# Altium schematic sheet rev-b1_case_charger.SchDoc
size 297 x 209 mm; Symbol: Drawing-Symbol_A4; @Project Name: Atrium_RevB1; @Page Count: 1; @Update Date: 2026-11-05; @Create Date: 2026-11-05; @Schematic Name: Schematic1; @Page No: 1; @Page Name: P1; Company: Local Forge; Version: V1.0; Page Size: A4; Drawn: Het Bhavsar; Device: Drawing-Symbol_A4; @Create Time: 20:16:12; @Update Time: 20:16:12; Border: 1; Width: 1170; Height: 825; Region Start: 1; X Region Count: 6; Y Region Count: 4; Blade Width: 10; Title Block Position: 3; @Board Name: zArchive_Case_old_rev
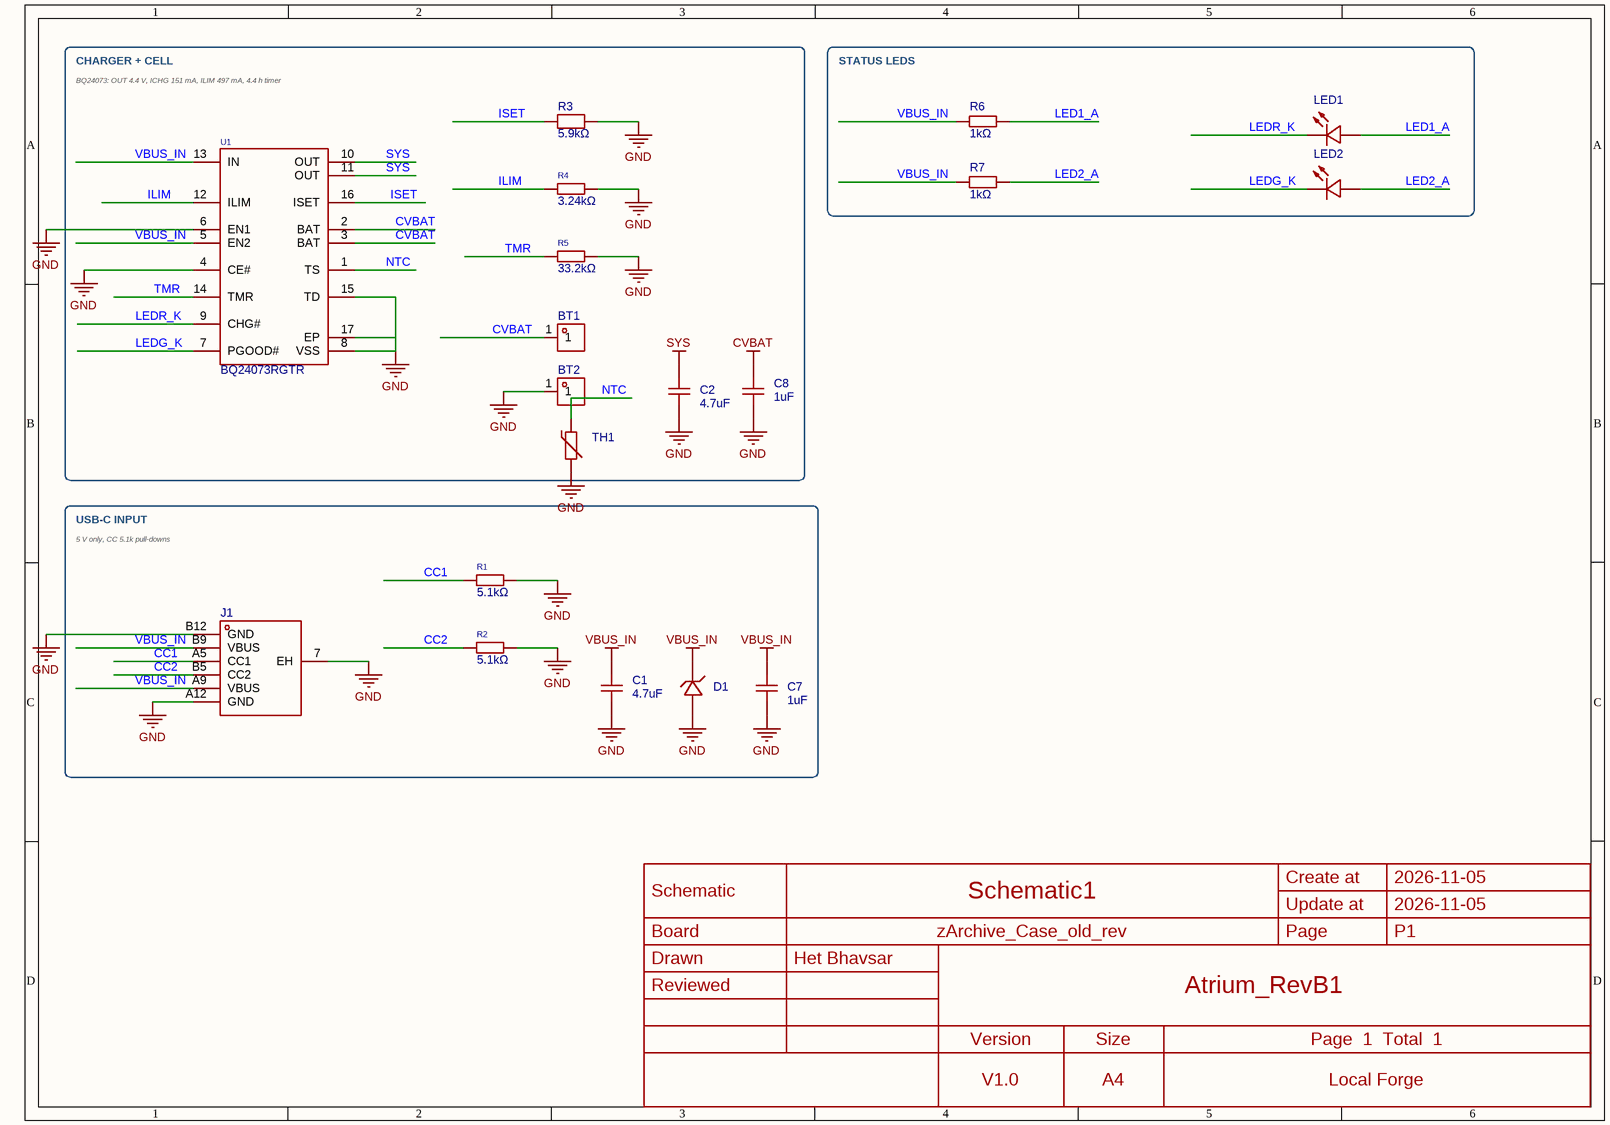
[diagram p0: rev-b1_case_charger.SchDoc]

## Parts
BT1  YZR0154-15039-02  [TESTPOINT-SMD_BD1.5-H3.9]  (value not drawn)
BT2  YZR0154-15039-02  [TESTPOINT-SMD_BD1.5-H3.9]  (value not drawn)
C1  4.7uF  [C0603]
C2  4.7uF  [C0603]
C7  1uF  [C0402]
C8  1uF  [C0402]
D1  SMF6.0A  [SOD-123FL_L2.8-W1.9-LS3.7-RD]  (value not drawn)
J1  TYPE-C 6P(073)  [TYPE-C-SMD_TYPE-C-6P-073]  (value not drawn)
LED1  KT-0603R  [LED-SMD_L1.6-W0.8-R-RD]  (value not drawn)
LED2  KT-0603G  [LED0603-RD]  (value not drawn)
R1  5.1kΩ  [R0402]
R2  5.1kΩ  [R0402]
R3  5.9kΩ  [R0402]
R4  3.24kΩ  [R0402]
R5  33.2kΩ  [R0402]
R6  1kΩ  [R0402]
R7  1kΩ  [R0402]
TH1  NCU15XH103F60RC  [R0402]  (value not drawn)
U1  BQ24073RGTR  [QFN-16_L3.0-W3.0-P0.50-TL-EP1.7]

## Blocks framed on the sheet
CHARGER + CELL: BT1 BT2 C2 C8 R3-R5 TH1 U1
STATUS LEDS: LED1 LED2 R6 R7
USB-C INPUT: C1 C7 D1 J1 R1 R2

## Nets
CVBAT: BT1.1 C8.1 U1.2(BAT) U1.3(BAT)
GND: BT2.1 C1.2 C2.2 C7.2 C8.2 D1.2(A) J1.7(EH) J1.A12(GND) J1.B12(GND) R1.2 R2.2 R3.2 R4.2 R5.2 TH1.2 U1.4(CE#) U1.6(EN1) U1.8(VSS) U1.15(TD) U1.17(EP)
SYS: C2.1 U1.10(OUT) U1.11(OUT)
VBUS_IN: C1.1 C7.1 D1.1(C) J1.A9(VBUS) J1.B9(VBUS) R6.1 R7.1 U1.5(EN2) U1.13(IN)
CC1: J1.A5(CC1) R1.1
CC2: J1.B5(CC2) R2.1
ILIM: R4.1 U1.12(ILIM)
ISET: R3.1 U1.16(ISET)
LED1_A: LED1.1(A) R6.2
LED2_A: LED2.2(A) R7.2
LEDG_K: LED2.1(K) U1.7(PGOOD#)
LEDR_K: LED1.2(K) U1.9(CHG#)
NTC: TH1.1 U1.1(TS)
TMR: R5.1 U1.14(TMR)

## Notes on the sheet
- BQ24073: OUT 4.4 V, ICHG 151 mA, ILIM 497 mA, 4.4 h timer
- 5 V only, CC 5.1k pull-downs
- Create at
- 2026-11-05
- Schematic
- Board
- Schematic1
- zArchive_Case_old_rev
- Update at
- Page
- P1
- Drawn
- Reviewed
- Het Bhavsar
- Atrium_RevB1
- Version
- V1.0
- Size
- A4
- Page  1  Total  1
- Local Forge

## Library data of the parts
BT1 BT2 = YZR0154-15039-02: Type:Pogo Pin Number of Pins:1P Overall Length/Height:3.9mm Operational Height:3.1mm Contact Resistance:50mΩ Elastic Life:10000 times Current Rating:1A Voltage Rating:12V Contact Material:Lead-Free Copper Contact Plating:Gold Operating Temperature:-20℃~+7; Manufacturer: Xinyangze(鑫扬泽); Add into BOM: no; Convert to PCB: yes; Overall Length/Height: 3.9mm; Operational Height: 3.1mm; Contact Resistance: 50mΩ; Current Rating: 1A; Voltage Rating: 12V; Symbol: YZR0154-15039-02; Device: YZR0154-15039-02; Manufacturer Part: YZR0154-15039-02; Supplier: LCSC; Supplier Part: C5157388; LCSC Part Name: POGO PIN贴片型弹簧顶针; Supplier Footprint: -; JLCPCB Part Class: Extended Part; Datasheet: https://item.szlcsc.com/datasheet/YZR0154-15039-02/5795506.html; Type: Pogo Pin; Number of Pins: 1P; Elastic Life: 10000 times; Contact Material: Lead-Free Copper; Contact Plating: Gold; Operating Temperature: -20℃~+70℃; FootprintName: TESTPOINT-SMD_BD1.5-H3.9
C1 C2 = CL10A475KO8NNNC: Capacitance:4.7uF Tolerance:±10% Tolerance:±10% Voltage Rating:16V Temperature Coefficient:X5R; Manufacturer: SAMSUNG(三星); Add into BOM: yes; Tolerance: ±10%; Voltage Rating: 16V; Temperature Coefficient: X5R; ModelId: 624118aa3cc7497086c383c2d72e08520819f05c4eef4c71ace90d822a990e87; ModelName: C0603_L1.6-W0.8-H0.8; ModelTransform: 62.992,31.496,0,0,0,0,0,0,0; Symbol: CL10A475KO8NNNC; Device: CL10A475KO8NNNC; Convert to PCB: yes; Manufacturer Part: CL10A475KO8NNNC; Supplier: LCSC; Supplier Part: C19666; LCSC Part Name: 4.7uF ±10% 16V; Supplier Footprint: 0603; JLCPCB Part Class: Basic Part; Datasheet: https://item.szlcsc.com/datasheet/CL10A475KO8NNNC/20375.html; Value: 4.7uF; FootprintName: C0603
C7 C8 = CL05A105KA5NQNC: Capacitance:1uF Tolerance:±10% Tolerance:±10% Voltage Rating:25V Temperature Coefficient:X5R; Manufacturer: SAMSUNG(三星); Add into BOM: yes; Tolerance: ±10%; Voltage Rating: 25V; Temperature Coefficient: X5R; ModelId: b7d13df3e9464d7a99d0651d1a5b4d570819f05c4eef4c71ace90d822a990e87; ModelName: C0402_L1.0-W0.5-H0.5; ModelTransform: 39.37,19.685,0,0,0,0,0,0,0; Symbol: CL05A105KA5NQNC; Device: CL05A105KA5NQNC; Convert to PCB: yes; Manufacturer Part: CL05A105KA5NQNC; Supplier: LCSC; Supplier Part: C52923; LCSC Part Name: 1uF ±10% 25V; Supplier Footprint: 0402; JLCPCB Part Class: Basic Part; Datasheet: https://item.szlcsc.com/datasheet/CL05A105KA5NQNC/53938.html; Value: 1uF; FootprintName: C0402
D1 = SMF6.0A_C2857264: Polarity:Unidirectional Reverse Stand-Off Voltage (Vrwm):6V Clamping Voltage:10.3V Peak Pulse Current (Ipp):19.4A Peak Pulse Power Dissipation (Ppp):200W Voltage - Breakdown:6.7V Reverse Leakage Current (Ir):100uA Number of Channels:1 Operating Temperatur; Manufacturer: JSMSEMI(杰盛微); Add into BOM: yes; Reverse Stand-Off Voltage (Vrwm): 6V; Clamping Voltage: 10.3V; Peak Pulse Current (Ipp): 19.4A; Peak Pulse Power Dissipation (Ppp): 200W; Voltage - Breakdown: 6.7V; Reverse Leakage Current (Ir): 100uA; Number of Channels: 1; Type: TVS; ModelId: 651a00fc4da743e19c1dbf8711bab2380819f05c4eef4c71ace90d822a990e87; ModelTransform: 141.732,74.803,0,0,0,0,0,0,0; Symbol: SMF6.0A_C2857264; Device: SMF6.0A_C2857264; Convert to PCB: yes; Manufacturer Part: SMF6.0A; Supplier: LCSC; Supplier Part: C2857264; LCSC Part Name: TVS 6V截止 峰值浪涌电流：19.4A; Supplier Footprint: SOD-123FL; JLCPCB Part Class: Extended Part; Datasheet: https://item.szlcsc.com/datasheet/SMF6.0A/3057376.html; Polarity: Unidirectional; Operating Temperature: -55℃~+150℃; level of protection: -; Junction Capacitance: -; FootprintName: SOD-123FL_L2.8-W1.9-LS3.7-RD; ModelName: SOD-123FL_L2.8-W1.9-LS3.7-RD
J1 = TYPE-C 6P(073): Connector Type:Type-C Protocol Standard:- Gender:Female Mounting Type:Surface Mount, Right Angle Number of Contacts:6P Number of Ports:1 Current Rating-Power:3A Voltage Rating:5V Connect-Disconnect Life:10,000 cycles Supplementary Features:- Center Height; Manufacturer: SHOU HAN(首韩); Add into BOM: yes; Gender: Female; Number of Ports: 1; Current Rating-Power: 3A; Voltage Rating: 5V; Detection color: Black; ModelId: 5572357f2a5242b0b12e4512f7b213ab0819f05c4eef4c71ace90d822a990e87; ModelTransform: 351.968,281.49546,0,0,0,0,0.002,-46.967,-39.37; Symbol: TYPE-C 6P(073); Device: TYPE-C 6P(073); Convert to PCB: yes; Manufacturer Part: TYPE-C 6P(073); Supplier: LCSC; Supplier Part: C668623; LCSC Part Name: Type-C 母 卧贴; Supplier Footprint: SMD; JLCPCB Part Class: Extended Part; Datasheet: https://item.szlcsc.com/datasheet/TYPE-C%25206P(073)/698566.html; Connector Type: Type-C; Protocol Standard: -; Mounting Type: Surface Mount, Right Angle; Number of Contacts: 6P; Connect-Disconnect Life: 10,000 cycles; Supplementary Features: -; Center Height: -; Length: 6.8mm; Operating Temperature: -30℃~+80℃; FootprintName: TYPE-C-SMD_TYPE-C-6P-073; ModelName: TYPE-C-SMD_TYPE-C-6P-073
LED1 = KT-0603R: Lamp Holder Type:1.6mm x 0.8mm square LED Illumination Color:Red Voltage - Forward(Vf):1.8V~2.4V Voltage - Forward(Vf):1.8V~2.4V Power(Watts):40mW Forward Current:20mA Wavelength - Dominant:615nm~630nm Wavelength - Dominant:615nm~630nm Peak Wavelength:645; Manufacturer: KENTO; Add into BOM: yes; Illumination Color: Red; Power(Watts): 40mW; Forward Current: 20mA; Peak Wavelength: 645nm; Diode Configuration: Discrete Diode; Lens Color: Water Clear; Luminous Intensity: 300mcd; Viewing Angle: 120°; ModelId: 19cc79473bbc420a8203ad67d1a57d420819f05c4eef4c71ace90d822a990e87; ModelName: LED0603_L1.6-W0.8-H0.6; ModelTransform: 63.7794,31.496,0,0,0,0,0,0,0; Symbol: KT-0603R; Device: KT-0603R; Convert to PCB: yes; Manufacturer Part: KT-0603R; Supplier: LCSC; Supplier Part: C2286; LCSC Part Name: 0603 红灯 高亮; Supplier Footprint: 0603; JLCPCB Part Class: Basic Part; Datasheet: https://item.szlcsc.com/datasheet/KT-0603R/2659.html; Lamp Holder Type: 1.6mm x 0.8mm square LED; Voltage - Forward(Vf): 1.8V~2.4V; Wavelength - Dominant: 615nm~630nm; Color Temperature: -; Mounting Style: -; Operating Temperature: -40℃~+85℃; FootprintName: LED-SMD_L1.6-W0.8-R-RD
LED2 = KT-0603G: Lamp Holder Type:1.6mm x 0.8mm square LED Illumination Color:Emerald Green Voltage - Forward(Vf):3.1V Voltage - Forward(Vf):3.1V Power(Watts):100mW Forward Current:5mA Wavelength - Dominant:513nm~528nm Wavelength - Dominant:513nm~528nm Peak Wavelength:525; Manufacturer: KENTO; Symbol: 0603 Green 509-620mcd; Add into BOM: yes; Voltage - Forward(Vf): 3.1V; Power(Watts): 100mW; Forward Current: 5mA; Peak Wavelength: 525nm; Diode Configuration: Discrete Diode; Lens Color: Water Clear; Luminous Intensity: 430mcd; Viewing Angle: 120°; ModelId: 5e3b568068dd46cf8019c1d1baa0031b0819f05c4eef4c71ace90d822a990e87; ModelTransform: 63.7794,32.283,0,0,0,0,0,0,0; Device: KT-0603G; Convert to PCB: yes; Manufacturer Part: KT-0603G; Supplier: LCSC; Supplier Part: C12624; LCSC Part Name: 0603 翠绿 高亮; Supplier Footprint: 0603; JLCPCB Part Class: Extended Part; Datasheet: https://item.szlcsc.com/datasheet/KT-0603G/13258.html; Lamp Holder Type: 1.6mm x 0.8mm square LED; Illumination Color: Emerald Green; Wavelength - Dominant: 513nm~528nm; Color Temperature: -; Mounting Style: -; Operating Temperature: -40℃~+85℃; FootprintName: LED0603-RD; ModelName: LED0603-RD
R1 R2 = 0402WGF5101TCE: Type:Thick Film Resistor Resistance:5.1kΩ Tolerance:±1% Tolerance:±1% Power(Watts):62.5mW Voltage-Supply(Max):50V Temperature Coefficient:±100ppm/℃ Temperature Coefficient:±100ppm/℃ Operating Temperature:-55℃~+155℃ Operating Temperature:-55℃~+155℃; Manufacturer: UNI-ROYAL(厚声); Add into BOM: yes; Tolerance: ±1%; Power(Watts): 62.5mW; Voltage-Supply(Max): 50V; ModelId: efdecb7dae4442949d28eecaf748420f0819f05c4eef4c71ace90d822a990e87; ModelName: R0402_L1.0-W0.5-H0.4; ModelTransform: 39.37,19.685,0,0,0,0,0,0,0; Symbol: 0402WGF5101TCE; Device: 0402WGF5101TCE; Convert to PCB: yes; Manufacturer Part: 0402WGF5101TCE; Supplier: LCSC; Supplier Part: C25905; Value: 5.1kΩ; JLCPCB Part Class: Basic Part; LCSC Part Name: 厚膜电阻 5.1kΩ ±1%; Supplier Footprint: 0402; Datasheet: https://item.szlcsc.com/datasheet/0402WGF5101TCE/26648.html; Type: Thick Film Resistor; Temperature Coefficient: ±100ppm/℃; Operating Temperature: -55℃~+155℃; FootprintName: R0402
R3 = RC0402FR-075K9L: Type:Thick Film Resistor Resistance:5.9kΩ Tolerance:±1% Tolerance:±1% Power(Watts):62.5mW Voltage-Supply(Max):50V Temperature Coefficient:±100ppm/℃ Temperature Coefficient:±100ppm/℃ Operating Temperature:-55℃~+155℃ Operating Temperature:-55℃~+155℃; Manufacturer: YAGEO(国巨); Add into BOM: yes; Tolerance: ±1%; Power(Watts): 62.5mW; Voltage-Supply(Max): 50V; ModelId: efdecb7dae4442949d28eecaf748420f0819f05c4eef4c71ace90d822a990e87; ModelName: R0402_L1.0-W0.5-H0.4; ModelTransform: 39.37,19.685,0,0,0,0,0,0,0; Symbol: RC0402FR-075K9L; Device: RC0402FR-075K9L; Convert to PCB: yes; Manufacturer Part: RC0402FR-075K9L; Supplier: LCSC; Supplier Part: C273691; LCSC Part Name: 厚膜电阻 5.9kΩ ±1%; Supplier Footprint: 0402; JLCPCB Part Class: Extended Part; Datasheet: https://item.szlcsc.com/datasheet/RC0402FR-075K9L/262106.html; Type: Thick Film Resistor; Value: 5.9kΩ; Temperature Coefficient: ±100ppm/℃; Operating Temperature: -55℃~+155℃; FootprintName: R0402
R4 = 0402WGF3241TCE: Type:Thick Film Resistor Resistance:3.24kΩ Tolerance:±1% Tolerance:±1% Power(Watts):62.5mW Voltage-Supply(Max):50V Temperature Coefficient:±100ppm/℃ Temperature Coefficient:±100ppm/℃ Operating Temperature:-55℃~+155℃ Operating Temperature:-55℃~+155℃; Manufacturer: UNI-ROYAL(厚声); Add into BOM: yes; Tolerance: ±1%; Power(Watts): 62.5mW; Voltage-Supply(Max): 50V; ModelId: efdecb7dae4442949d28eecaf748420f0819f05c4eef4c71ace90d822a990e87; ModelName: R0402_L1.0-W0.5-H0.4; ModelTransform: 39.37,19.685,0,0,0,0,0,0,0; Symbol: 0402WGF3241TCE; Device: 0402WGF3241TCE; Convert to PCB: yes; Manufacturer Part: 0402WGF3241TCE; Supplier: LCSC; Supplier Part: C11457; Value: 3.24kΩ; JLCPCB Part Class: Extended Part; LCSC Part Name: 厚膜电阻 3.24kΩ ±1%; Supplier Footprint: 0402; Datasheet: https://item.szlcsc.com/datasheet/0402WGF3241TCE/12011.html; Type: Thick Film Resistor; Temperature Coefficient: ±100ppm/℃; Operating Temperature: -55℃~+155℃; FootprintName: R0402
R5 = 0402WGF3322TCE: Type:Thick Film Resistor Resistance:33.2kΩ Tolerance:±1% Tolerance:±1% Power(Watts):62.5mW Voltage-Supply(Max):50V Temperature Coefficient:±100ppm/℃ Temperature Coefficient:±100ppm/℃ Operating Temperature:-55℃~+155℃ Operating Temperature:-55℃~+155℃; Manufacturer: UNI-ROYAL(厚声); Add into BOM: yes; Tolerance: ±1%; Power(Watts): 62.5mW; Voltage-Supply(Max): 50V; ModelId: efdecb7dae4442949d28eecaf748420f0819f05c4eef4c71ace90d822a990e87; ModelName: R0402_L1.0-W0.5-H0.4; ModelTransform: 39.37,19.685,0,0,0,0,0,0,0; Symbol: 0402WGF3322TCE; Device: 0402WGF3322TCE; Convert to PCB: yes; Manufacturer Part: 0402WGF3322TCE; Supplier: LCSC; Supplier Part: C122548; Value: 33.2kΩ; JLCPCB Part Class: Extended Part; LCSC Part Name: 33.2kΩ ±1% 62.5mW 厚膜电阻; Supplier Footprint: 0402; Datasheet: https://item.szlcsc.com/datasheet/0402WGF3322TCE/123817.html; Type: Thick Film Resistor; Temperature Coefficient: ±100ppm/℃; Operating Temperature: -55℃~+155℃; FootprintName: R0402
R6 R7 = 0402WGF1001TCE: Type:Thick Film Resistor Resistance:1kΩ Tolerance:±1% Tolerance:±1% Power(Watts):62.5mW Voltage-Supply(Max):50V Temperature Coefficient:±100ppm/℃ Temperature Coefficient:±100ppm/℃ Operating Temperature:-55℃~+155℃ Operating Temperature:-55℃~+155℃; Manufacturer: UNI-ROYAL(厚声); Add into BOM: yes; Tolerance: ±1%; Power(Watts): 62.5mW; Voltage-Supply(Max): 50V; ModelId: efdecb7dae4442949d28eecaf748420f0819f05c4eef4c71ace90d822a990e87; ModelName: R0402_L1.0-W0.5-H0.4; ModelTransform: 39.37,19.685,0,0,0,0,0,0,0; Symbol: 0402WGF1001TCE; Device: 0402WGF1001TCE; Convert to PCB: yes; Manufacturer Part: 0402WGF1001TCE; Supplier: LCSC; Supplier Part: C11702; LCSC Part Name: 厚膜电阻 1kΩ ±1%; Supplier Footprint: 0402; JLCPCB Part Class: Basic Part; Datasheet: https://item.szlcsc.com/datasheet/0402WGF1001TCE/12256.html; Type: Thick Film Resistor; Value: 1kΩ; Temperature Coefficient: ±100ppm/℃; Operating Temperature: -55℃~+155℃; FootprintName: R0402
TH1 = NCU15XH103F60RC: Power(Watts):1mW Resistance @ 25℃:10kΩ Resistance Tolerance:±1% Resistance Tolerance:±1% B Constant Tolerance:±1% B Constant (25℃/50℃):3380K B Constant (25℃/75℃):- B Constant (25℃/85℃):3434K B Constant (25℃/100℃):3455K Steady State Current (Max):- Dissipa; Manufacturer: muRata(村田); Add into BOM: yes; Power(Watts): 1mW; Resistance @ 25℃: 10kΩ; Resistance Tolerance: ±1%; B Constant (25℃/50℃): 3380K; B Constant (25℃/85℃): 3434K; B Constant (25℃/100℃): 3455K; Dissipation Factor: 1mW/℃; ModelId: efdecb7dae4442949d28eecaf748420f0819f05c4eef4c71ace90d822a990e87; ModelName: R0402_L1.0-W0.5-H0.4; ModelTransform: 39.37,19.685,0,0,0,0,0,0,0; Symbol: NCU15XH103F60RC; Device: NCU15XH103F60RC; Convert to PCB: yes; Manufacturer Part: NCU15XH103F60RC; Supplier: LCSC; Supplier Part: C237326; LCSC Part Name: 10kΩ 3380K; Supplier Footprint: 0402; JLCPCB Part Class: Extended Part; Datasheet: https://item.szlcsc.com/datasheet/NCU15XH103F60RC/236770.html; B Constant Tolerance: ±1%; B Constant (25℃/75℃): -; Steady State Current (Max): -; Thermal Time Constant: -; Operating Temperature: -40℃~+125℃; Diameter (φD): -; Length: 1mm; Width: 0.5mm; Height: -; Pitch: -; FootprintName: R0402
U1 = BQ24073RGTR: The Chip Type:Charging IC Voltage - Supply:4.35V~6.4V Voltage - Supply:4.35V~6.4V Charge Current - Max:1.5A Charging Saturation Voltage:4.2V End-Off Voltage:- Type of Battery:Lithium Battery Number of Cells:- Number of Cells:- Operating Temperature:-40℃~+; Manufacturer: TI(德州仪器); Add into BOM: yes; Charge Current - Max: 1.5A; Charging Saturation Voltage: 4.2V; Battery Temperature Detection: Support; 0V Battery Charge: Not supported; Supply Current (Iq): 50uA; ModelId: 91d63201192f454a99473c0c0750bb850819f05c4eef4c71ace90d822a990e87; ModelName: QFN-16_L3.0-W3.0-P0.50-EP1.7; ModelTransform: 118.8974,118.8974,0,0,0,0,0,0,0; Symbol: BQ24073RGTR; Device: BQ24073RGTR; Convert to PCB: yes; Manufacturer Part: BQ24073RGTR; Supplier: LCSC; Supplier Part: C15220; JLCPCB Part Class: Extended Part; LCSC Part Name: 1.5A USB友好型锂离子电池充电器和电源路径管理IC; Supplier Footprint: QFN-16-EP(3x3); Datasheet: https://www.ti.com/cn/lit/ds/symlink/bq24075.pdf; The Chip Type: Charging IC; Voltage - Supply: 4.35V~6.4V; End-Off Voltage: -; Type of Battery: Lithium Battery; Number of Cells: -; Operating Temperature: -40℃~+125℃; Balance Current: -; Interface: -; Features: -; FootprintName: QFN-16_L3.0-W3.0-P0.50-TL-EP1.7